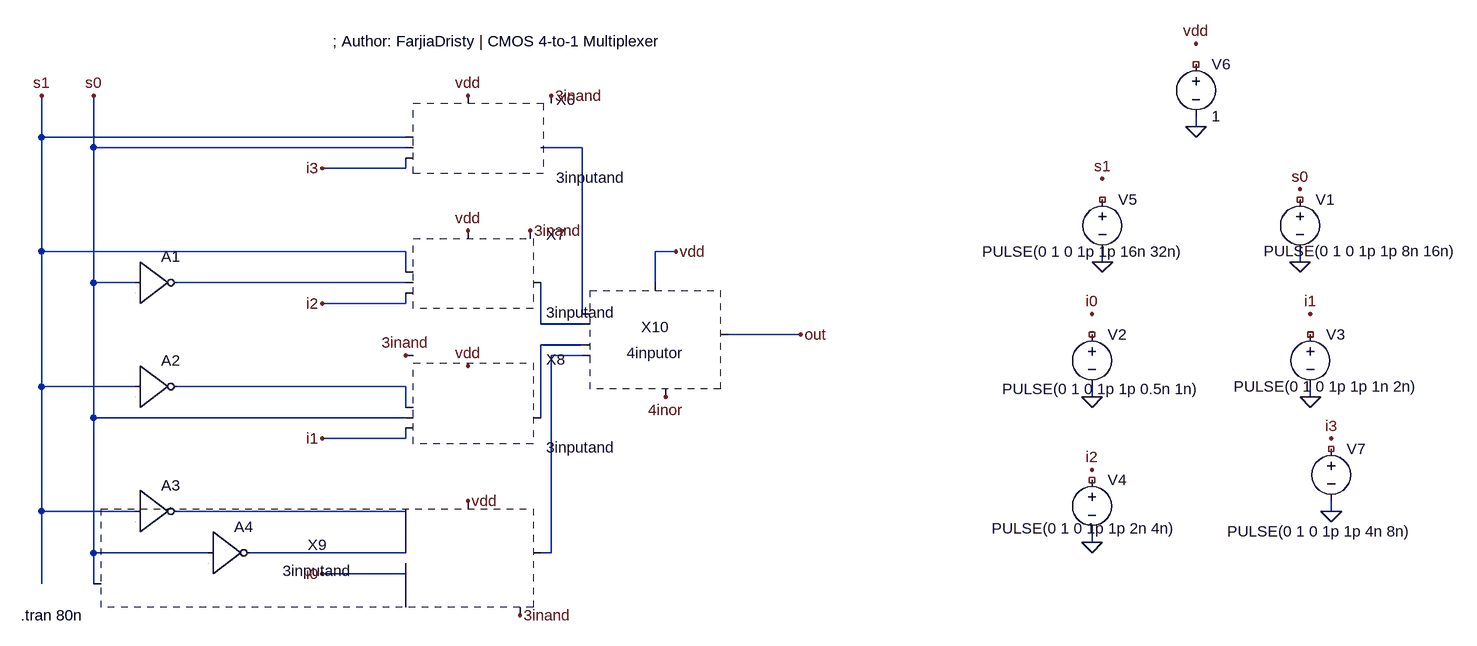
[diagram p0: schematic cmos_4x1_multiplexer.asc]
cmos_4x1_multiplexer.asc, the LTspice schematic file:
Version 4
SHEET 1 1812 828
WIRE 1328 32 1328 16
WIRE -448 48 -448 -16
WIRE 112 48 -448 48
WIRE -368 64 -368 -16
WIRE 112 64 -368 64
WIRE 384 64 320 64
WIRE 112 96 112 80
WIRE 112 96 -16 96
WIRE -448 224 -448 48
WIRE 112 224 -448 224
WIRE 528 224 496 224
WIRE 1184 240 1184 224
WIRE 1488 240 1488 224
WIRE 112 256 112 224
WIRE -368 272 -368 64
WIRE -304 272 -368 272
WIRE 112 272 -240 272
WIRE 496 272 496 224
WIRE 112 304 112 288
WIRE 112 304 -16 304
WIRE 384 320 384 64
WIRE 320 336 320 272
WIRE 384 336 320 336
WIRE 720 352 608 352
WIRE 384 368 320 368
WIRE 384 384 336 384
WIRE -448 432 -448 224
WIRE -304 432 -448 432
WIRE 112 432 -240 432
WIRE 1168 448 1168 432
WIRE 1504 448 1504 432
WIRE 112 464 112 432
WIRE -368 480 -368 272
WIRE 112 480 -368 480
WIRE 320 480 320 368
WIRE 112 512 112 496
WIRE 112 512 -16 512
WIRE -448 624 -448 432
WIRE -304 624 -448 624
WIRE 112 624 -240 624
WIRE 1536 624 1536 608
WIRE 112 672 112 624
WIRE 1168 672 1168 656
WIRE -368 688 -368 480
WIRE -192 688 -368 688
WIRE 112 688 -128 688
WIRE 336 688 336 384
WIRE 336 688 320 688
WIRE 112 720 112 704
WIRE 112 720 -16 720
WIRE -448 736 -448 624
WIRE -368 736 -368 688
FLAG 208 -16 vdd
FLAG 208 192 vdd
FLAG 208 400 vdd
FLAG 208 608 vdd
FLAG -16 96 i3
FLAG -16 304 i2
FLAG -16 720 i0
FLAG -16 512 i1
FLAG -448 -16 s1
FLAG -368 -16 s0
FLAG 1328 32 0
FLAG 1184 240 0
FLAG 1488 240 0
FLAG 1168 448 0
FLAG 1504 448 0
FLAG 1168 672 0
FLAG 1184 112 s1
FLAG 1488 128 s0
FLAG 1168 320 i0
FLAG 1504 320 i1
FLAG 1168 560 i2
FLAG 1536 624 0
FLAG 1536 512 i3
FLAG 528 224 vdd
FLAG 1328 -96 vdd
FLAG 720 352 out
FLAG 336 -16 3inand
FLAG 304 192 3inand
FLAG 112 384 3inand
FLAG 288 784 3inand
FLAG 512 448 4inor
SYMBOL Digital\\inv -304 208 R0
SYMATTR InstName A1
SYMBOL Digital\\inv -304 368 R0
SYMATTR InstName A2
SYMBOL Digital\\inv -304 560 R0
SYMATTR InstName A3
SYMBOL Digital\\inv -192 624 R0
SYMATTR InstName A4
SYMBOL voltage 1488 128 R0
WINDOW 3 -56 95 Left 2
WINDOW 123 0 0 Left 0
WINDOW 39 0 0 Left 0
SYMATTR Value PULSE(0 1 0 1p 1p 8n 16n)
SYMATTR InstName V1
SYMBOL voltage 1168 336 R0
WINDOW 3 -138 100 Left 2
WINDOW 123 0 0 Left 0
WINDOW 39 0 0 Left 0
SYMATTR Value PULSE(0 1 0 1p 1p 0.5n 1n)
SYMATTR InstName V2
SYMBOL voltage 1504 336 R0
WINDOW 3 -118 96 Left 2
WINDOW 123 0 0 Left 0
WINDOW 39 0 0 Left 0
SYMATTR Value PULSE(0 1 0 1p 1p 1n 2n)
SYMATTR InstName V3
SYMBOL voltage 1168 560 R0
WINDOW 3 -154 90 Left 2
WINDOW 123 0 0 Left 0
WINDOW 39 0 0 Left 0
SYMATTR Value PULSE(0 1 0 1p 1p 2n 4n)
SYMATTR InstName V4
SYMBOL voltage 1184 128 R0
WINDOW 3 -185 96 Left 2
WINDOW 123 0 0 Left 0
WINDOW 39 0 0 Left 0
SYMATTR Value PULSE(0 1 0 1p 1p 16n 32n)
SYMATTR InstName V5
SYMBOL voltage 1328 -80 R0
WINDOW 123 0 0 Left 0
WINDOW 39 0 0 Left 0
SYMATTR InstName V6
SYMATTR Value 1
SYMBOL voltage 1536 512 R0
WINDOW 3 -160 143 Left 2
WINDOW 123 0 0 Left 0
WINDOW 39 0 0 Left 0
SYMATTR Value PULSE(0 1 0 1p 1p 4n 8n)
SYMATTR InstName V7
SYMBOL 3inputand 176 64 R0
SYMATTR InstName X6
SYMBOL 3inputand 176 272 R0
SYMATTR InstName X7
SYMBOL 3inputand 176 480 R0
SYMATTR InstName X8
SYMBOL 3inputand 176 688 R0
SYMATTR InstName X9
SYMBOL 4inputor 480 352 R0
SYMATTR InstName X10
TEXT -480 784 Left 2 !.tran 80n

TEXT 0 -100 Left 2 !; Author: FarjiaDristy | CMOS 4-to-1 Multiplexer

The netlist it stands for:
* cmos_4x1_multiplexer.asc
A1 s0 0 0 0 0 N002 0 0 BUF
A2 s1 0 0 0 0 N006 0 0 BUF
A3 s1 0 0 0 0 N007 0 0 BUF
A4 s0 0 0 0 0 N008 0 0 BUF
V1 NC_01 0 PULSE(0 1 0 1p 1p 8n 16n)
V2 NC_02 0 PULSE(0 1 0 1p 1p 0.5n 1n)
V3 NC_03 0 PULSE(0 1 0 1p 1p 1n 2n)
V4 NC_04 0 PULSE(0 1 0 1p 1p 2n 4n)
V5 NC_05 0 PULSE(0 1 0 1p 1p 16n 32n)
V6 NC_06 0 1
V7 NC_07 0 PULSE(0 1 0 1p 1p 4n 8n)
* X6: 3inputand (symbol 3inputand not available, pin order unknown); nets seen at it: 3inand, i3, N001, s0, s1, vdd
* X7: 3inputand (symbol 3inputand not available, pin order unknown); nets seen at it: 3inand, i2, N002, N003, s1, vdd
* X8: 3inputand (symbol 3inputand not available, pin order unknown); nets seen at it: 3inand, i1, N004, N006, s0, vdd
* X9: 3inputand (symbol 3inputand not available, pin order unknown); nets seen at it: 3inand, i0, N005, N007, N008, s0, vdd
* X10: 4inputor (symbol 4inputor not available, pin order unknown); nets seen at it: 4inor, N001, N003, N004, N005, out, vdd
.tran 80n
; Author: FarjiaDristy | CMOS 4-to-1 Multiplexer
.backanno
.end